# Altium schematic sheet STPMotorControl7_1.SchDoc
size A4; SheetNumber: 8; SheetTotal: 8
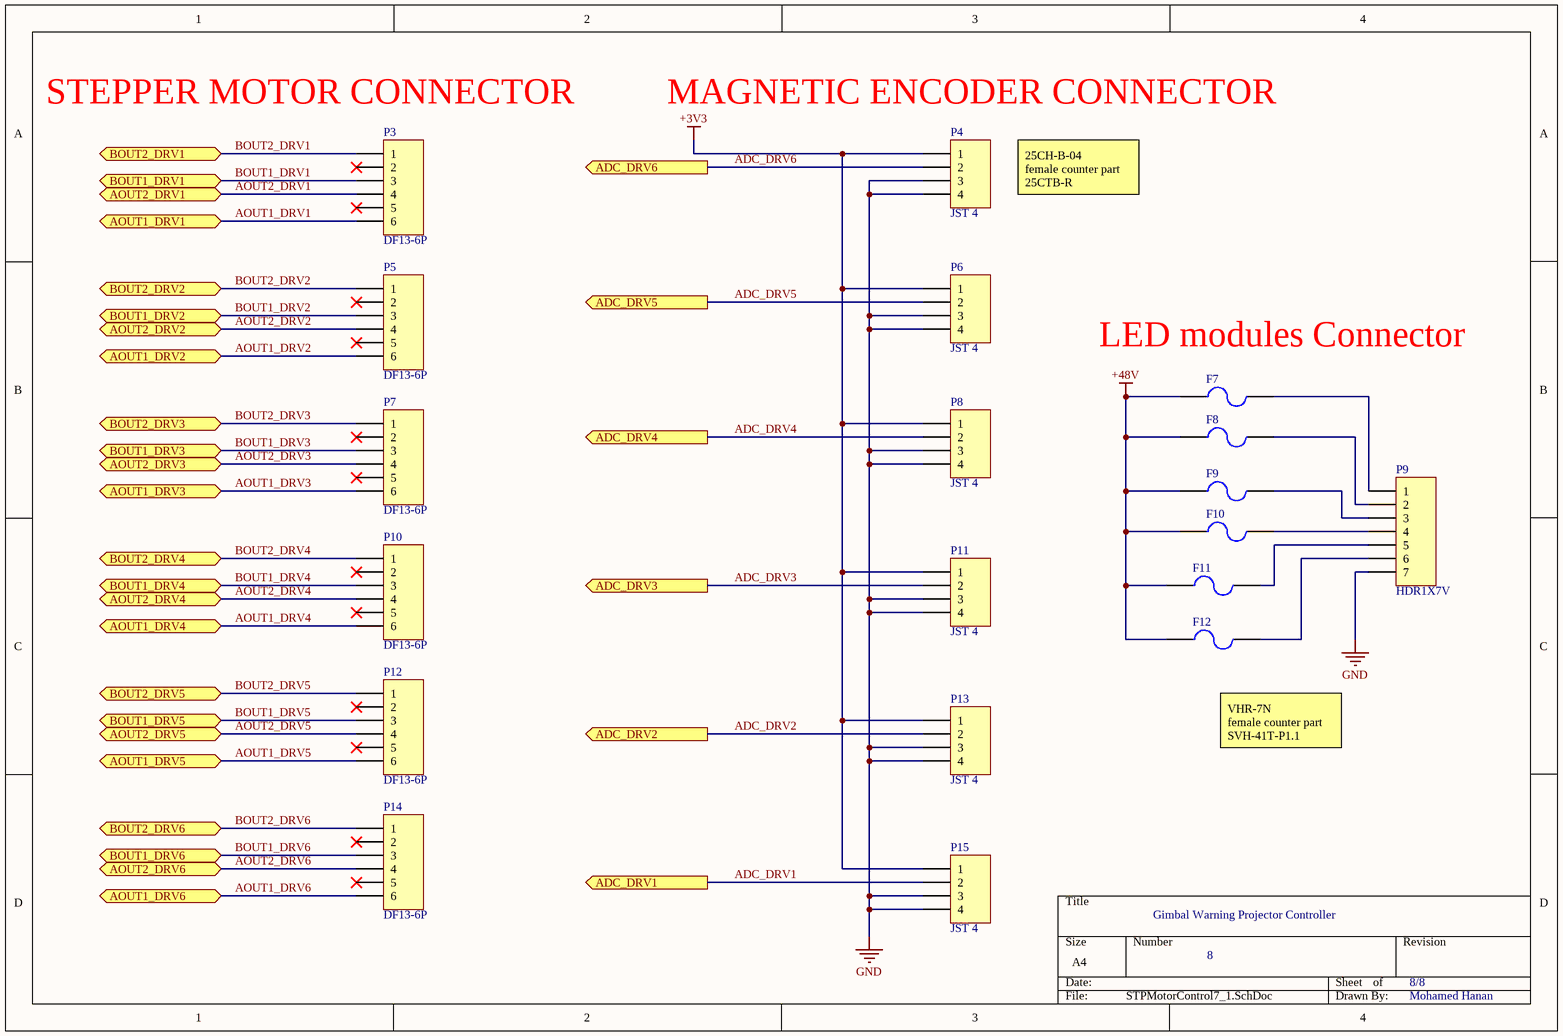
[diagram p0: STPMotorControl7_1.SchDoc]

## Parts
F7  1206L035/16YR  [MC36207]  (value not drawn)
F8  1206L035/16YR  [MC36207]  (value not drawn)
F9  1206L035/16YR  [MC36207]  (value not drawn)
F10  1206L035/16YR  [MC36207]  (value not drawn)
F11  1206L035/16YR  [MC36207]  (value not drawn)
F12  1206L035/16YR  [MC36207]  (value not drawn)
P3  DF13-6P  [DF13-6]
P4  JST 4  [XA-4]
P5  DF13-6P  [DF13-6]
P6  JST 4  [XA-4]
P7  DF13-6P  [DF13-6]
P8  JST 4  [XA-4]
P9  HDR1X7V  [HDR1X7_AUT]
P10  DF13-6P  [DF13-6]
P11  JST 4  [XA-4]
P12  DF13-6P  [DF13-6]
P13  JST 4  [XA-4]
P14  DF13-6P  [DF13-6]
P15  JST 4  [XA-4]

## Ports
ADC_DRV1 (out, see STPMotorConnections[3C], STPMotorControl_1[1C]), ADC_DRV2 (out, see STPMotorConnections[3C], STPMotorControl_1[1C]), ADC_DRV3 (out, see STPMotorConnections[3C], STPMotorControl_1[1D]), ADC_DRV4 (out, see STPMotorConnections[3C], STPMotorControl_1[1D]), ADC_DRV5 (out, see STPMotorConnections[3C], STPMotorControl_1[1D]), ADC_DRV6 (out, see STPMotorConnections[3C], STPMotorControl_1[1D]), AOUT1_DRV1 (bidir, see STPMotorConnections[3C], STPMotorControl4_1[1C]), AOUT1_DRV2 (bidir, see STPMotorConnections[3C], STPMotorControl4_1[3A]), AOUT1_DRV3 (bidir, see STPMotorConnections[3D], STPMotorControl5_1[1C]), AOUT1_DRV4 (bidir, see STPMotorConnections[4C], STPMotorControl5_1[3A]), AOUT1_DRV5 (bidir, see STPMotorConnections[4C], STPMotorControl6_1[1C]), AOUT1_DRV6 (bidir, see STPMotorConnections[4C], STPMotorControl6_1[3A]), AOUT2_DRV1 (bidir, see STPMotorConnections[3C], STPMotorControl4_1[1C]), AOUT2_DRV2 (bidir, see STPMotorConnections[3C], STPMotorControl4_1[3A]), AOUT2_DRV3 (bidir, see STPMotorConnections[3D], STPMotorControl5_1[1C]), AOUT2_DRV4 (bidir, see STPMotorConnections[4C], STPMotorControl5_1[3A]), AOUT2_DRV5 (bidir, see STPMotorConnections[4C], STPMotorControl6_1[1C]), AOUT2_DRV6 (bidir, see STPMotorConnections[4C], STPMotorControl6_1[3A]), BOUT1_DRV1 (bidir, see STPMotorConnections[3C], STPMotorControl4_1[1C]), BOUT1_DRV2 (bidir, see STPMotorConnections[3C], STPMotorControl4_1[3B]), BOUT1_DRV3 (bidir, see STPMotorConnections[3D], STPMotorControl5_1[1C]), BOUT1_DRV4 (bidir, see STPMotorConnections[4C], STPMotorControl5_1[3B]), BOUT1_DRV5 (bidir, see STPMotorConnections[4C], STPMotorControl6_1[1C]), BOUT1_DRV6 (bidir, see STPMotorConnections[4C], STPMotorControl6_1[3B]), BOUT2_DRV1 (bidir, see STPMotorConnections[3C], STPMotorControl4_1[1C]), BOUT2_DRV2 (bidir, see STPMotorConnections[3C], STPMotorControl4_1[3B]), BOUT2_DRV3 (bidir, see STPMotorConnections[3D], STPMotorControl5_1[1C]), BOUT2_DRV4 (bidir, see STPMotorConnections[4C], STPMotorControl5_1[3B]), BOUT2_DRV5 (bidir, see STPMotorConnections[4C], STPMotorControl6_1[1C]), BOUT2_DRV6 (bidir, see STPMotorConnections[4C], STPMotorControl6_1[3B])

## Nets
+3V3: P4.1 P6.1 P8.1 P11.1 P13.1 P15.1
+48V: F7.1 F8.1 F9.1 F10.1 F11.1 F12.1
GND: P4.3 P4.4 P6.3 P6.4 P8.3 P8.4 P9.7 P11.3 P11.4 P13.3 P13.4 P15.3 P15.4
ADC_DRV1: P15.2 ; port ADC_DRV1
ADC_DRV2: P13.2 ; port ADC_DRV2
ADC_DRV3: P11.2 ; port ADC_DRV3
ADC_DRV4: P8.2 ; port ADC_DRV4
ADC_DRV5: P6.2 ; port ADC_DRV5
ADC_DRV6: P4.2 ; port ADC_DRV6
AOUT1_DRV1: P3.6 ; port AOUT1_DRV1
AOUT1_DRV2: P5.6 ; port AOUT1_DRV2
AOUT1_DRV3: P7.6 ; port AOUT1_DRV3
AOUT1_DRV4: P10.6 ; port AOUT1_DRV4
AOUT1_DRV5: P12.6 ; port AOUT1_DRV5
AOUT1_DRV6: P14.6 ; port AOUT1_DRV6
AOUT2_DRV1: P3.4 ; port AOUT2_DRV1
AOUT2_DRV2: P5.4 ; port AOUT2_DRV2
AOUT2_DRV3: P7.4 ; port AOUT2_DRV3
AOUT2_DRV4: P10.4 ; port AOUT2_DRV4
AOUT2_DRV5: P12.4 ; port AOUT2_DRV5
AOUT2_DRV6: P14.4 ; port AOUT2_DRV6
BOUT1_DRV1: P3.3 ; port BOUT1_DRV1
BOUT1_DRV2: P5.3 ; port BOUT1_DRV2
BOUT1_DRV3: P7.3 ; port BOUT1_DRV3
BOUT1_DRV4: P10.3 ; port BOUT1_DRV4
BOUT1_DRV5: P12.3 ; port BOUT1_DRV5
BOUT1_DRV6: P14.3 ; port BOUT1_DRV6
BOUT2_DRV1: P3.1 ; port BOUT2_DRV1
BOUT2_DRV2: P5.1 ; port BOUT2_DRV2
BOUT2_DRV3: P7.1 ; port BOUT2_DRV3
BOUT2_DRV4: P10.1 ; port BOUT2_DRV4
BOUT2_DRV5: P12.1 ; port BOUT2_DRV5
BOUT2_DRV6: P14.1 ; port BOUT2_DRV6
NetF7_2: F7.2 P9.1
NetF8_2: F8.2 P9.2
NetF9_2: F9.2 P9.3
NetF10_2: F10.2 P9.4
NetF11_2: F11.2 P9.5
NetF12_2: F12.2 P9.6

Not connected (* = marked no-connect by the designer): P3 2* 5*; P5 2* 5*; P7 2* 5*; P10 2* 5*; P12 2* 5*; P14 2* 5*

## Notes on the sheet
- (near P3) STEPPER MOTOR CONNECTOR
- (near P4) MAGNETIC ENCODER CONNECTOR
- 25CH-B-04
  female counter part
  25CTB-R
- (near F7) LED modules Connector
- VHR-7N
  female counter part
  SVH-41T-P1.1
- Gimbal Warning Projector Controller
- 8
- 8/8
- Mohamed Hanan

## Library data of the parts
F7-F12 = 1206L035/16YR: Fuse, PTC Reset, 350mA Hold, 750mA Tripping, 16v; Supplier 1: Element14; Supplier Part Number 1: 1822203
P3 P5 P7 P10 P12 P14 = DF13-6P: HIROSE(HRS)  DF13-6P-1.25H(20)  Wire-To-Board Connector, Right Angle, DF13 Series, Surface Mount, Header, 6 Contacts, 1.25 mm; Supplier 1: Farnell; Supplier Part Number 1: 1324928
P4 P6 P8 P11 P13 P15 = JST XA Header 4: JST XA Header, 4-Pin, Pitch 2.5mm; Supplier 1: Farnell; Supplier Part Number 1: 9492089
P9 = HDR1X7V: Header, Plug, 2.54mm, 7 Pins, Straight; Supplier 1: Farnell; Supplier Part Number 1: 9731121